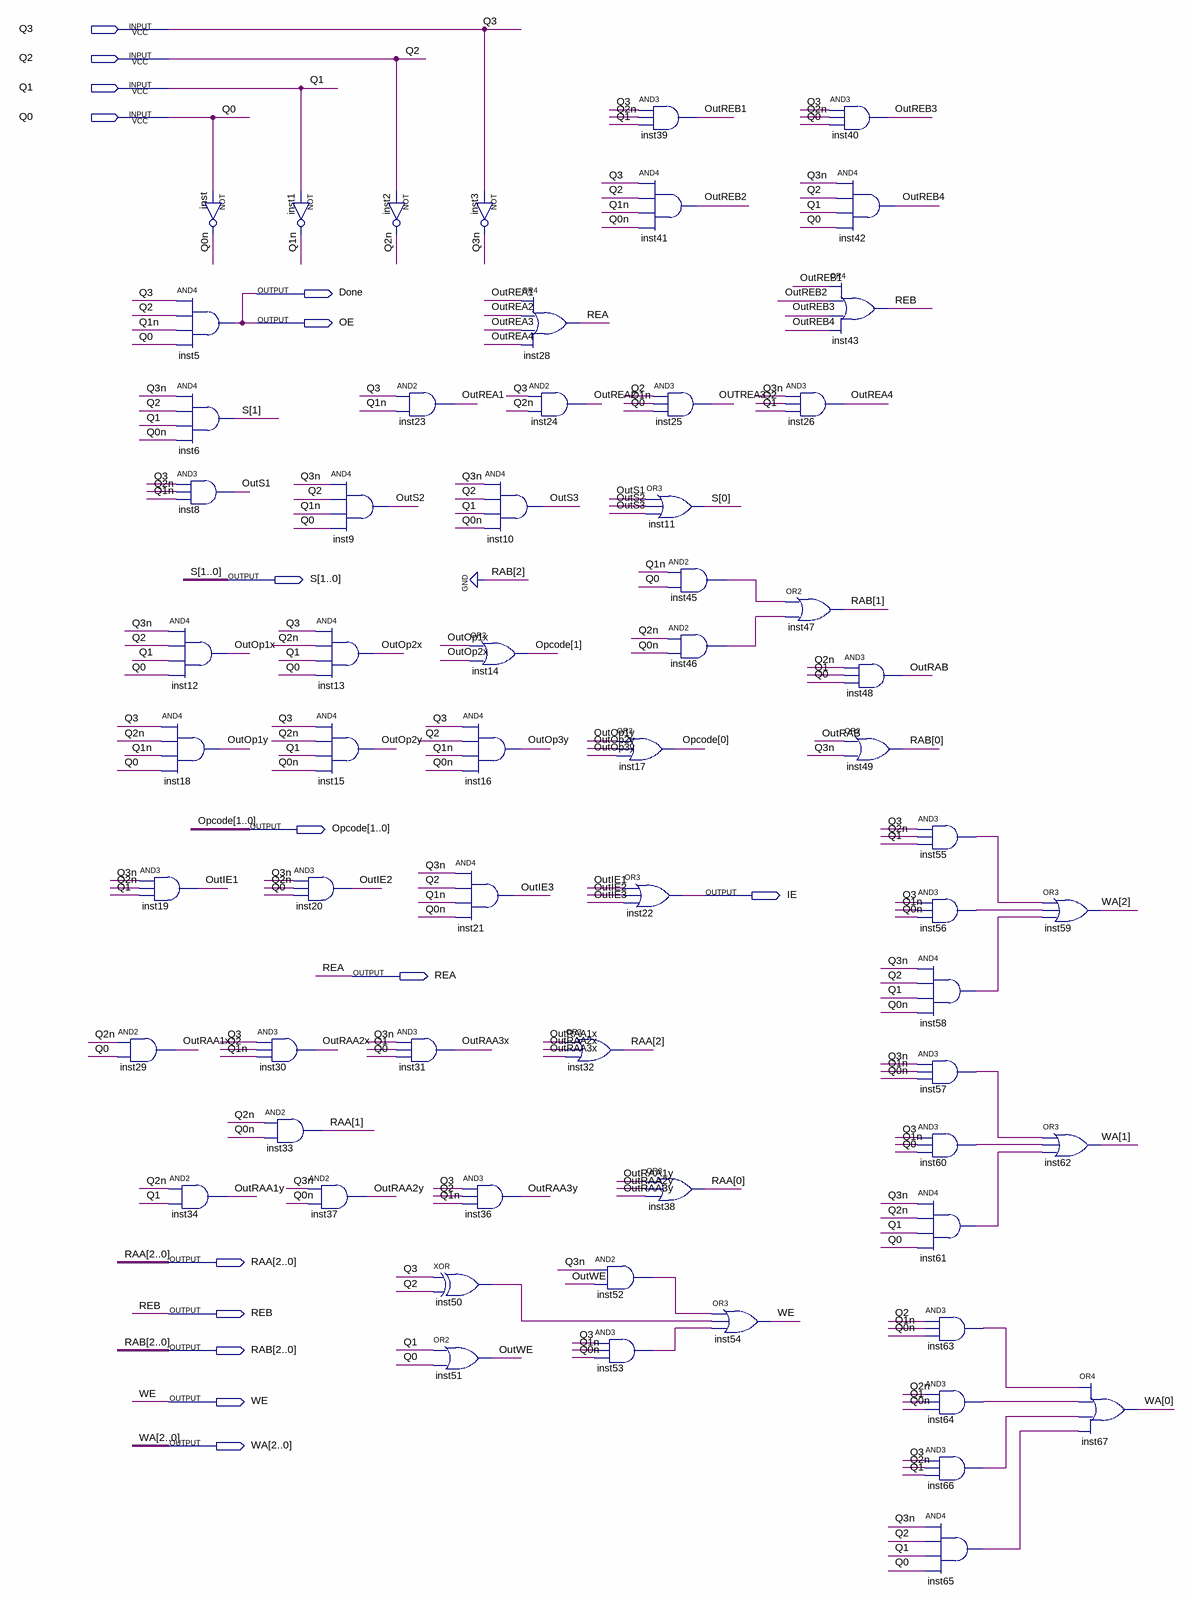
[diagram p0: schematic sheet]
// Quartus schematic output_logic.bdf as structural Verilog: 63 symbols, 15 pins
module output_logic (
  input  Q3,
  input  Q2,
  input  Q1,
  input  Q0,
  output Done,
  output OE,
  output [1:0] S,
  output [1:0] Opcode,
  output IE,
  output REA,
  output [2:0] RAA,
  output REB,
  output [2:0] RAB,
  output WE,
  output [2:0] WA
);

  wire inst45_out, inst46_out, inst50_out, inst52_out, inst53_out, inst55_out, inst56_out, inst57_out,
       inst58_out, inst60_out, inst61_out, inst63_out, inst64_out, inst65_out, inst66_out, OutIE1, OutIE2,
       OutIE3, OutOp1x, OutOp1y, OutOp2x, OutOp2y, OutOp3y, OutRAA1x, OutRAA1y, OutRAA2x, OutRAA2y, OutRAA3x,
       OutRAA3y, OutRAB, OutREA1, OutREA2, OUTREA3, OutREA4, OutREB1, OutREB2, OutREB3, OutREB4, OutS1,
       OutS2, OutS3, OutWE, Q0n, Q1n, Q2n, Q3n;

  and inst19 (OutIE1, Q3n, Q2n, Q1);
  and inst29 (OutRAA1x, Q2n, Q0);
  not inst (Q0n, Q0);
  and inst5 (Done, Q3, Q2, Q1n, Q0);
  and inst6 (S[1], Q3n, Q2, Q1, Q0n);
  and inst8 (OutS1, Q3, Q2n, Q1n);
  and inst12 (OutOp1x, Q3n, Q2, Q1, Q0);
  and inst18 (OutOp1y, Q3, Q2n, Q1n, Q0);
  and inst34 (OutRAA1y, Q2n, Q1);
  and inst30 (OutRAA2x, Q3, Q2, Q1n);
  and inst33 (RAA[1], Q2n, Q0n);
  not inst1 (Q1n, Q1);
  and inst13 (OutOp2x, Q3, Q2n, Q1, Q0);
  and inst15 (OutOp2y, Q3, Q2n, Q1, Q0n);
  and inst20 (OutIE2, Q3n, Q2n, Q0);
  and inst37 (OutRAA2y, Q3n, Q0n);
  not inst2 (Q2n, Q2);
  and inst9 (OutS2, Q3n, Q2, Q1n, Q0);
  and inst23 (OutREA1, Q3, Q1n);
  and inst31 (OutRAA3x, Q3n, Q1, Q0);
  xor inst50 (inst50_out, Q3, Q2);
  or inst51 (OutWE, Q1, Q0);
  not inst3 (Q3n, Q3);
  and inst10 (OutS3, Q3n, Q2, Q1, Q0n);
  or inst14 (Opcode[1], OutOp1x, OutOp2x);
  and inst16 (OutOp3y, Q3, Q2, Q1n, Q0n);
  and inst21 (OutIE3, Q3n, Q2, Q1n, Q0n);
  and inst36 (OutRAA3y, Q3, Q2, Q1n);
  or inst28 (REA, OutREA1, OutREA2, OUTREA3, OutREA4);
  and inst24 (OutREA2, Q3, Q2n);
  or inst17 (Opcode[0], OutOp1y, OutOp2y, OutOp3y);
  or inst32 (RAA[2], OutRAA1x, OutRAA2x, OutRAA3x);
  and inst52 (inst52_out, Q3n, OutWE);
  and inst53 (inst53_out, Q3, Q1n, Q0n);
  and inst39 (OutREB1, Q3, Q2n, Q1);
  and inst41 (OutREB2, Q3, Q2, Q1n, Q0n);
  and inst25 (OUTREA3, Q2, Q1n, Q0);
  or inst11 (S[0], OutS1, OutS2, OutS3);
  and inst45 (inst45_out, Q1n, Q0);
  and inst46 (inst46_out, Q2n, Q0n);
  or inst22 (IE, OutIE1, OutIE2, OutIE3);
  or inst38 (RAA[0], OutRAA1y, OutRAA2y, OutRAA3y);
  or inst54 (WE, inst52_out, inst50_out, inst53_out);
  and inst26 (OutREA4, Q3n, Q2, Q1);
  or inst47 (RAB[1], inst45_out, inst46_out);
  and inst40 (OutREB3, Q3, Q2n, Q0);
  and inst42 (OutREB4, Q3n, Q2, Q1, Q0);
  or inst43 (REB, OutREB1, OutREB2, OutREB3, OutREB4);
  and inst48 (OutRAB, Q2n, Q1, Q0);
  or inst49 (RAB[0], OutRAB, Q3n);
  and inst55 (inst55_out, Q3, Q2n, Q1);
  and inst56 (inst56_out, Q3, Q1n, Q0n);
  and inst58 (inst58_out, Q3n, Q2, Q1, Q0n);
  and inst57 (inst57_out, Q3n, Q1n, Q0n);
  and inst60 (inst60_out, Q3, Q1n, Q0);
  and inst61 (inst61_out, Q3n, Q2n, Q1, Q0);
  and inst63 (inst63_out, Q2, Q1n, Q0n);
  and inst64 (inst64_out, Q2n, Q1, Q0n);
  and inst66 (inst66_out, Q3, Q2n, Q1);
  and inst65 (inst65_out, Q3n, Q2, Q1, Q0);
  or inst59 (WA[2], inst55_out, inst56_out, inst58_out);
  or inst62 (WA[1], inst57_out, inst60_out, inst61_out);
  or inst67 (WA[0], inst63_out, inst64_out, inst66_out, inst65_out);

  assign OE = Done;
  assign RAB[2] = 1'b0;
endmodule
